# Altium schematic sheet frontend.SchDoc: Наименование
size 420 x 297 mm; ApprovedBy: Утвердил; CheckedBy: Проверил; Author: Разработал; CompanyName: ВлГУ; DrawnBy: Н.Контр; Engineer: Т.Контр; SheetNumber: 3; SheetTotal: 9; PageSetup: Record=PageOptions|CenterHorizontal=True|CenterVertical=True|PrintScale=0.94|XCorrection=1.00|YCorrection=1.00|PrintKind=1|BorderSize=5000000|LeftOffset=0|BottomOffset=0|Orientation=1|PaperLength=1000|PaperWidth=1000|Scale=100|PaperSource=7|PrintQuality=-4|MediaType=1|DitherType=10|PaperKind=A4|PrintScaleMode=1; DecimalNumber: Децимальный номер; HeadOfSector: Нач. сектора; MainDevice: Перв.примен.; Name: Наименование; DocumentName: Sheet1.SCHDOC
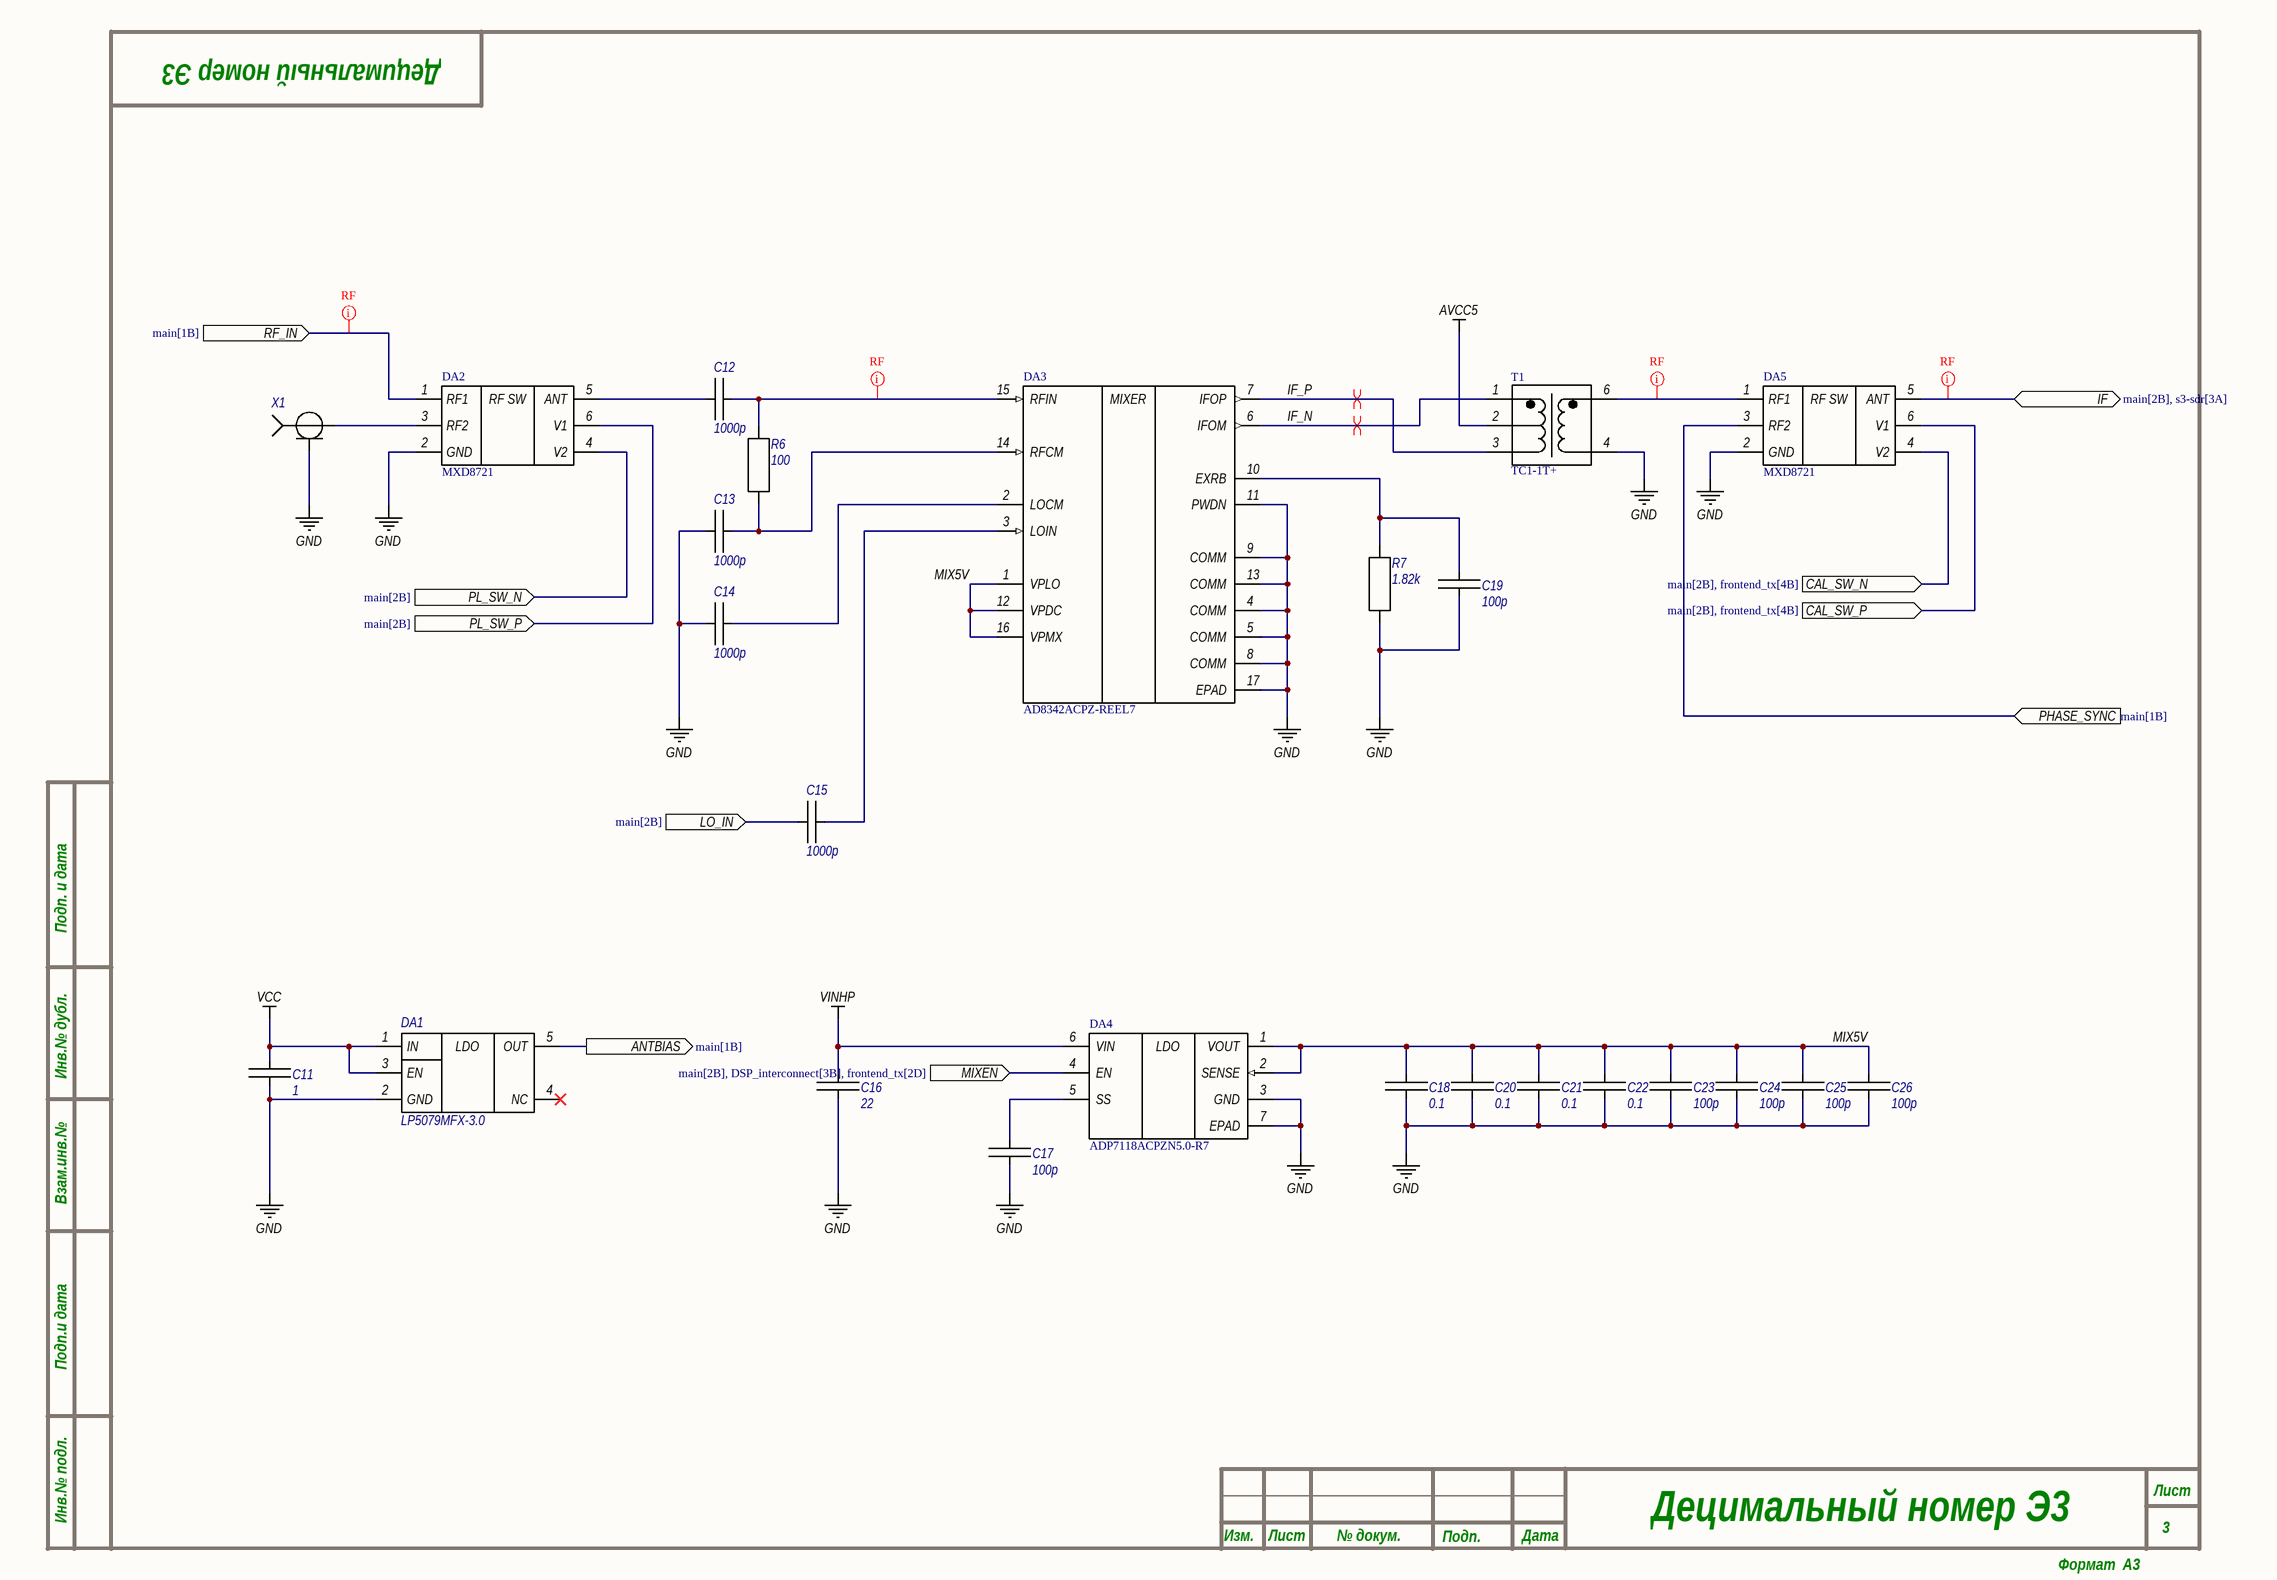
[diagram p0: frontend.SchDoc]

## Parts
C11  1  [C0805C]
C12  1000p  [C0402C]
C13  1000p  [C0402C]
C14  1000p  [C0402C]
C15  1000p  [C0402C]
C16  22  [C0805C]
C17  100p  [C0603C]
C18  0.1  [C0805C]
C19  100p  [C0603C]
C20  0.1  [C0805C]
C21  0.1  [C0805C]
C22  0.1  [C0805C]
C23  100p  [C0603C]
C24  100p  [C0603C]
C25  100p  [C0603C]
C26  100p  [C0603C]
DA1  LP5079MFX-3.0  [SOT23-5]
DA2  MXD8721  [SON35P100X50-6N]
DA3  AD8342ACPZ-REEL7  [CP_16_27_ADI-M]
DA4  ADP7118ACPZN5.0-R7  [CP-6-3_ADI]
DA5  MXD8721  [SON35P100X50-6N]
R6  100  [C0603R]
R7  1.82k  [C0603R]
T1  TC1-1T+  [AT224-1A_MNC]
X1  (no value)  [IPEX PAD]

## Ports
ANTBIAS (out, see main[1B]), CAL_SW_N (in, see main[2B], frontend_tx[4B]), CAL_SW_P (in, see main[2B], frontend_tx[4B]), IF (bidir, see main[2B], s3-sdr[3A]), LO_IN (in, see main[2B]), MIXEN (in, see main[2B], DSP_interconnect[3B], frontend_tx[2D]), PHASE_SYNC (in, see main[1B]), PL_SW_N (in, see main[2B]), PL_SW_P (in, see main[2B]), RF_IN (in, see main[1B])

## Nets
AVCC5: T1.2(SCONDARY_CT)
GND: C11.2 C13.1 C14.1 C16.2 C17.2 C18.2 C19.2 C20.2 C21.2 C22.2 C23.2 C24.2 C25.2 C26.2 DA1.2(GND) DA2.2(GND) DA3.4(COMM) DA3.5(COMM) DA3.8(COMM) DA3.9(COMM) DA3.11(PWDN) DA3.13(COMM) DA3.17(EPAD) DA4.3(GND) DA4.7(EPAD) DA5.2(GND) R7.2 T1.4(PRIMARY) X1.2
VCC: C11.1 DA1.1(IN) DA1.3(EN)
VINHP: C16.1 DA4.6(VIN)
ANTBIAS: DA1.5(OUT) ; port ANTBIAS
CAL_SW_N: DA5.4(V2) ; port CAL_SW_N
CAL_SW_P: DA5.6(V1) ; port CAL_SW_P
IF: DA5.5(ANT) ; port IF
IF_N: DA3.6(IFOM) T1.1(SECONDARY_DOT)
IF_P: DA3.7(IFOP) T1.3(SECONDARY)
LO_IN: C15.1 ; port LO_IN
MIX5V: C18.1 C20.1 C21.1 C22.1 C23.1 C24.1 C25.1 C26.1 DA3.1(VPLO) DA3.12(VPDC) DA3.16(VPMX) DA4.1(VOUT) DA4.2(SENSE)
MIXEN: DA4.4(EN) ; port MIXEN
PHASE_SYNC: DA5.3(RF2) ; port PHASE_SYNC
PL_SW_N: DA2.4(V2) ; port PL_SW_N
PL_SW_P: DA2.6(V1) ; port PL_SW_P
RF_IN: DA2.1(RF1) ; port RF_IN
NetC12_1: C12.1 DA2.5(ANT)
NetC12_2: C12.2 DA3.15(RFIN) R6.1
NetC13_2: C13.2 DA3.14(RFCM) R6.2
NetC14_2: C14.2 DA3.2(LOCM)
NetC15_2: C15.2 DA3.3(LOIN)
NetC17_1: C17.1 DA4.5(SS)
NetC19_1: C19.1 DA3.10(EXRB) R7.1
NetDA2_3: DA2.3(RF2) X1.1
NetDA5_1: DA5.1(RF1) T1.6(PRIMARY_DOT)

Not connected (* = marked no-connect by the designer): DA1 4(NC)*

## Layout directives
net class RF: IF, NetC12_2, NetDA5_1, RF_IN
differential pair: IF_N, IF_P

## Notes on the sheet
- Подп. и дата
- Инв.№ дубл.
- Взам.инв.№
- Подп.и дата
- Инв.№ подл.
- Изм.
- Лист
- № докум.
- Подп.
- Дата
- Формат  A3
- (in symbol AD8342ACPZ-REEL7) MIXER
- (in symbol ADP7118ACPZN5.0-R7) LDO
- (in symbol LP5907) LDO
- (in symbol MXD8721) RF SW

## Library data of the parts
C11-C26 = Cap
  C11: Value: 1
  C12-C15: Value: 1000p
  C16: Value: 22
  C17 C19 C23-C26: Value: 100p
  C18 C20-C22: Value: 0.1
DA1 = LP5907: Part number: LP5079MFX-3.0
DA2 DA5 = MXD8721: 0.5-6.0GHz SPDT Switch; Part number: MXD8721
DA3 = AD8342ACPZ-REEL7: Active Receive Mixer LF to 3 GHz; Manufacturer_Name: Analog Devices Inc; Copyright: Copyright (C) 2025 Ultra Librarian. All rights reserved.; Manufacturer_Part_Number: AD8342ACPZ-REEL7; RefDes: RefDes; Type: Type
DA4 = ADP7118ACPZN5.0-R7: 20 V, 200 mA, Low Noise, CMOS LDO Linear Regulator; Manufacturer_Name: Analog Devices Inc; Copyright: Copyright (C) 2026 Ultra Librarian. All rights reserved.; Manufacturer_Part_Number: ADP7118ACPZN5.0-R7; Datasheet: https://www.analog.com/media/en/technical-documentation/data-sheets/adp7118.pdf; RefDes: RefDes; Type: Type
R6 R7 = res
  R6: Value: 100
  R7: Value: 1.82k
T1 = TC1-1T+: Description; Manufacturer_Name: Mini Circuits; Type: Balun; Copyright: Copyright (C) 2026 Ultra Librarian. All rights reserved.; Manufacturer_Part_Number: TC1-1T+; RefDes: RefDes
X1 = Ipex